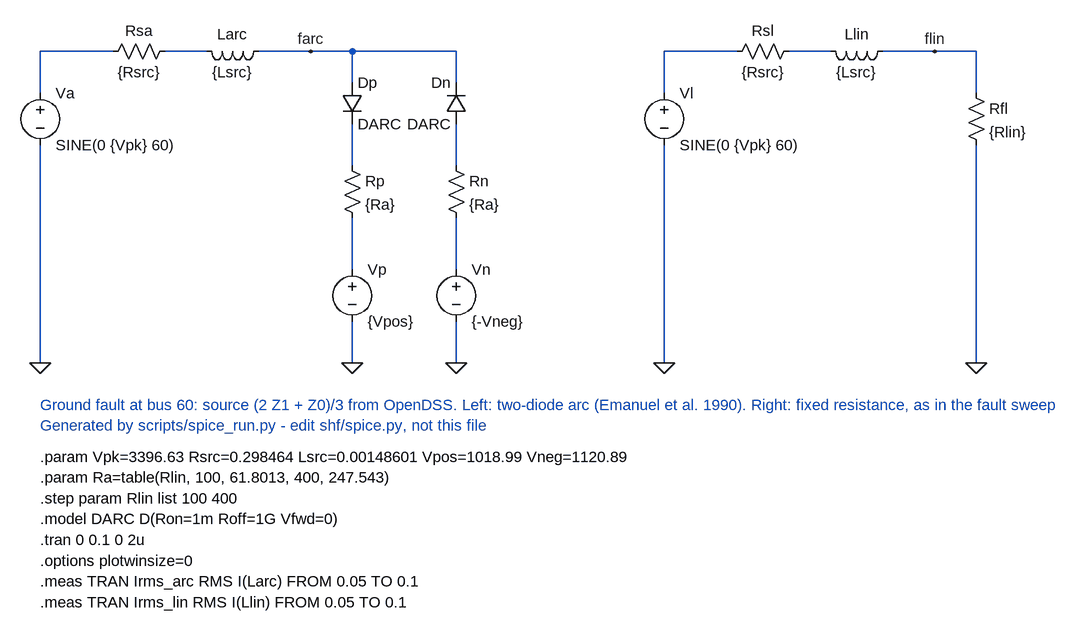
[diagram p0: schematic hif_arc.asc]
hif_arc.asc, the LTspice schematic file:
Version 4.1
SHEET 1 1600 1100
WIRE 64 112 64 176
WIRE 176 112 64 112
WIRE 320 112 256 112
WIRE 544 112 400 112
WIRE 704 112 544 112
WIRE 544 160 544 112
WIRE 704 160 704 112
WIRE 544 288 544 224
WIRE 544 448 544 368
WIRE 704 288 704 224
WIRE 704 448 704 368
WIRE 64 592 64 256
WIRE 544 592 544 528
WIRE 704 592 704 528
WIRE 1024 112 1024 176
WIRE 1136 112 1024 112
WIRE 1280 112 1216 112
WIRE 1504 112 1360 112
WIRE 1504 176 1504 112
WIRE 1024 592 1024 256
WIRE 1504 592 1504 256
FLAG 480 112 farc
FLAG 1440 112 flin
FLAG 64 592 0
FLAG 544 592 0
FLAG 704 592 0
FLAG 1024 592 0
FLAG 1504 592 0
SYMBOL voltage 64 160 R0
SYMATTR InstName Va
SYMATTR Value SINE(0 {Vpk} 60)
SYMBOL res 272 96 R90
WINDOW 0 0 56 VBottom 2
WINDOW 3 32 56 VTop 2
SYMATTR InstName Rsa
SYMATTR Value {Rsrc}
SYMBOL ind 416 96 R90
WINDOW 0 5 56 VBottom 2
WINDOW 3 32 56 VTop 2
SYMATTR InstName Larc
SYMATTR Value {Lsrc}
SYMATTR SpiceLine Rser=0
SYMBOL diode 528 160 R0
SYMATTR InstName Dp
SYMATTR Value DARC
SYMBOL res 528 272 R0
SYMATTR InstName Rp
SYMATTR Value {Ra}
SYMBOL voltage 544 432 R0
SYMATTR InstName Vp
SYMATTR Value {Vpos}
SYMBOL diode 720 224 R180
WINDOW 0 24 64 Left 2
WINDOW 3 24 0 Left 2
SYMATTR InstName Dn
SYMATTR Value DARC
SYMBOL res 688 272 R0
SYMATTR InstName Rn
SYMATTR Value {Ra}
SYMBOL voltage 704 432 R0
SYMATTR InstName Vn
SYMATTR Value {-Vneg}
SYMBOL voltage 1024 160 R0
SYMATTR InstName Vl
SYMATTR Value SINE(0 {Vpk} 60)
SYMBOL res 1232 96 R90
WINDOW 0 0 56 VBottom 2
WINDOW 3 32 56 VTop 2
SYMATTR InstName Rsl
SYMATTR Value {Rsrc}
SYMBOL ind 1376 96 R90
WINDOW 0 5 56 VBottom 2
WINDOW 3 32 56 VTop 2
SYMATTR InstName Llin
SYMATTR Value {Lsrc}
SYMATTR SpiceLine Rser=0
SYMBOL res 1488 160 R0
SYMATTR InstName Rfl
SYMATTR Value {Rlin}
TEXT 64 656 Left 2 ;Ground fault at bus 60: source (2 Z1 + Z0)/3 from OpenDSS. Left: two-diode arc (Emanuel et al. 1990). Right: fixed resistance, as in the fault sweep
TEXT 64 688 Left 2 ;Generated by scripts/spice_run.py - edit shf/spice.py, not this file
TEXT 64 736 Left 2 !.param Vpk=3396.63 Rsrc=0.298464 Lsrc=0.00148601 Vpos=1018.99 Vneg=1120.89
TEXT 64 768 Left 2 !.param Ra=table(Rlin, 100, 61.8013, 400, 247.543)
TEXT 64 800 Left 2 !.step param Rlin list 100 400
TEXT 64 832 Left 2 !.model DARC D(Ron=1m Roff=1G Vfwd=0)
TEXT 64 864 Left 2 !.tran 0 0.1 0 2u
TEXT 64 896 Left 2 !.options plotwinsize=0
TEXT 64 928 Left 2 !.meas TRAN Irms_arc RMS I(Larc) FROM 0.05 TO 0.1
TEXT 64 960 Left 2 !.meas TRAN Irms_lin RMS I(Llin) FROM 0.05 TO 0.1

The netlist it stands for:
* hif_arc.asc
Va N001 0 SINE(0 {Vpk} 60)
Rsa N002 N001 {Rsrc}
Larc farc N002 {Lsrc} Rser=0
Dp farc N003 DARC
Rp N003 N004 {Ra}
Vp N004 0 {Vpos}
Dn N005 farc DARC
Rn N005 N006 {Ra}
Vn N006 0 {-Vneg}
Vl N007 0 SINE(0 {Vpk} 60)
Rsl N008 N007 {Rsrc}
Llin flin N008 {Lsrc} Rser=0
Rfl flin 0 {Rlin}
.model D D
.lib standard.dio
* Ground fault at bus 60: source (2 Z1 + Z0)/3 from OpenDSS. Left: two-diode arc (Emanuel et al. 1990). Right: fixed resistance, as in the fault sweep
* Generated by scripts/spice_run.py - edit shf/spice.py, not this file
.param Vpk=3396.63 Rsrc=0.298464 Lsrc=0.00148601 Vpos=1018.99 Vneg=1120.89
.param Ra=table(Rlin, 100, 61.8013, 400, 247.543)
.step param Rlin list 100 400
.model DARC D(Ron=1m Roff=1G Vfwd=0)
.tran 0 0.1 0 2u
.options plotwinsize=0
.meas TRAN Irms_arc RMS I(Larc) FROM 0.05 TO 0.1
.meas TRAN Irms_lin RMS I(Llin) FROM 0.05 TO 0.1
.backanno
.end